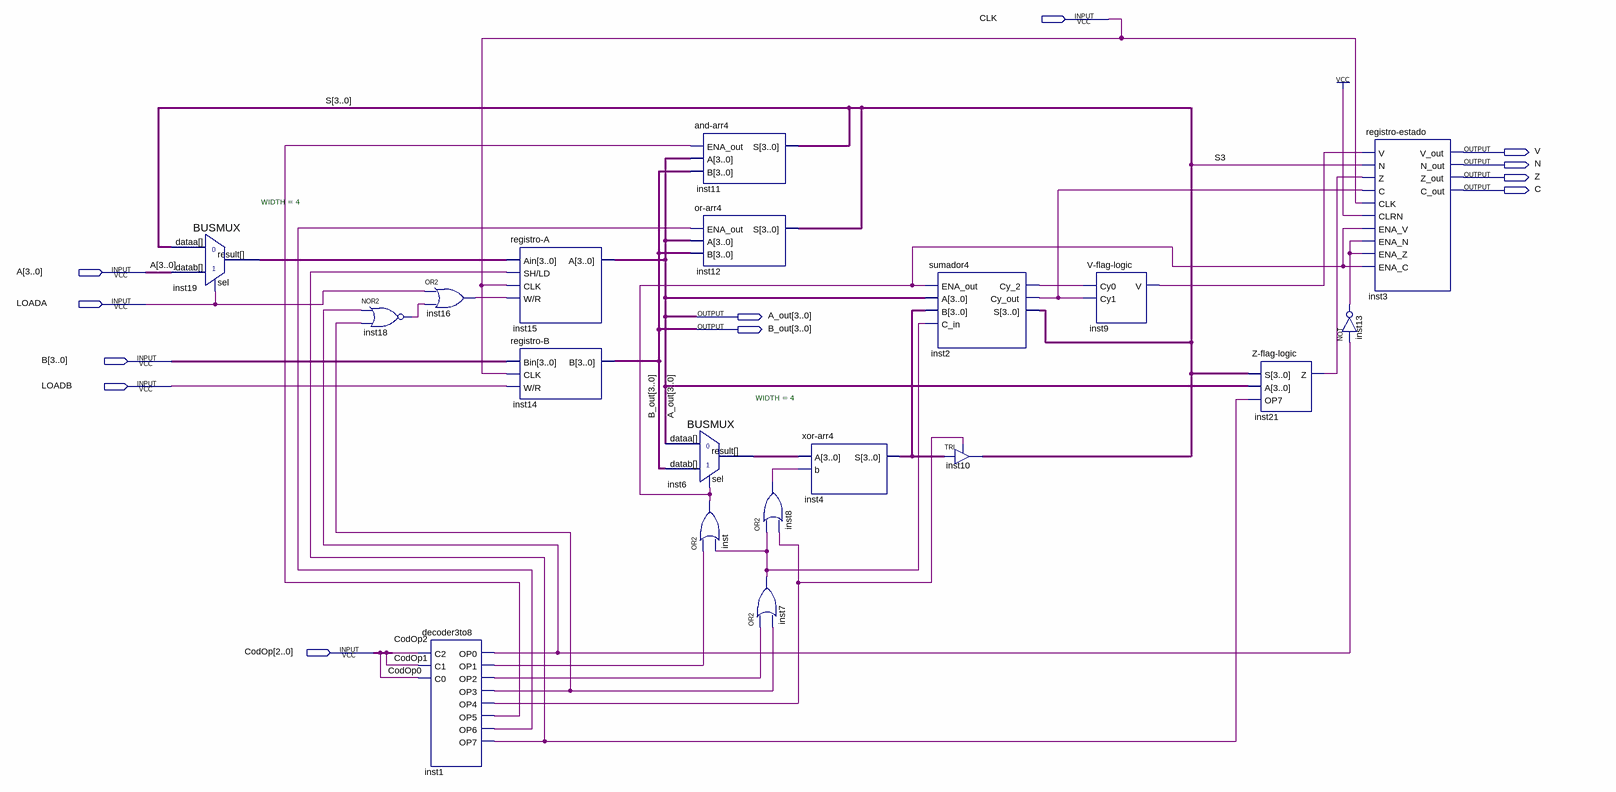
[diagram p0: schematic sheet]
// Quartus schematic TPI.bdf as structural Verilog: 19 symbols, 12 pins
module TPI (
  input  CLK,
  input  [3:0] A,
  input  LOADA,
  input  [3:0] B,
  input  LOADB,
  input  [2:0] CodOp,
  output V,
  output N,
  output Z,
  output C,
  output [3:0] A_out,
  output [3:0] B_out
);

  wire inst1_op0, inst1_op1, inst1_op2, inst1_op3, inst1_op4, inst1_op5, inst1_op6, inst1_op7, inst2_cy_2,
       inst2_cy_out, inst7_out, inst8_out, inst9_v, inst13_out, inst16_out, inst18_out, inst21_z, inst_out;
  wire [3:0] inst4_s, inst6_result, inst19_result, S;

  BUSMUX #(.WIDTH(4)) inst19 (.datab(A), .sel(LOADA), .dataa(S), .result(inst19_result));
  nor inst18 (inst18_out, inst1_op0, inst1_op3);
  or inst16 (inst16_out, LOADA, inst18_out);
  decoder3to8 inst1 (
    .C2(CodOp[2]), .C1(CodOp[1]), .C0(CodOp[0]), .OP0(inst1_op0), .OP1(inst1_op1), .OP2(inst1_op2),
    .OP3(inst1_op3), .OP4(inst1_op4), .OP5(inst1_op5), .OP6(inst1_op6), .OP7(inst1_op7));
  \registro-A  inst15 (.Ain(inst19_result), .\SH/LD (inst1_op7), .CLK(CLK), .\W/R (inst16_out), .A(A_out));
  \registro-B  inst14 (.Bin(B), .CLK(CLK), .\W/R (LOADB), .B(B_out));
  \and-arr4  inst11 (.ENA_out(inst1_op5), .A(A_out), .B(B_out), .S(S));
  \or-arr4  inst12 (.ENA_out(inst1_op6), .A(A_out), .B(B_out), .S(S));
  BUSMUX #(.WIDTH(4)) inst6 (.datab(B_out), .sel(inst_out), .dataa(A_out), .result(inst6_result));
  or inst (inst_out, inst1_op1, inst7_out);
  or inst8 (inst8_out, inst7_out, inst1_op4);
  or inst7 (inst7_out, inst1_op2, inst1_op3);
  \xor-arr4  inst4 (.A(inst6_result), .b(inst8_out), .S(inst4_s));
  sumador4 inst2 (
    .ENA_out(inst_out), .A(A_out), .B(inst4_s), .C_in(inst7_out), .Cy_2(inst2_cy_2), .Cy_out(inst2_cy_out),
    .S(S));
  TRI inst10[3:0] (.IN(inst4_s), .OE(inst1_op4), .OUT(S));
  \V-flag-logic  inst9 (.Cy0(inst2_cy_2), .Cy1(inst2_cy_out), .V(inst9_v));
  \Z-flag-logic  inst21 (.S(S), .A(A_out), .OP7(inst1_op7), .Z(inst21_z));
  \registro-estado  inst3 (
    .V(inst9_v), .N(S[3]), .Z(inst21_z), .C(inst2_cy_out), .CLK(CLK), .CLRN(1'b1), .ENA_V(inst_out),
    .ENA_N(inst13_out), .ENA_Z(inst13_out), .ENA_C(inst_out), .V_out(V), .N_out(N), .Z_out(Z), .C_out(C));
  not inst13 (inst13_out, inst1_op0);
endmodule
